# Altium schematic sheet Orion-Bridge-R4-Power.SchDoc
size A2
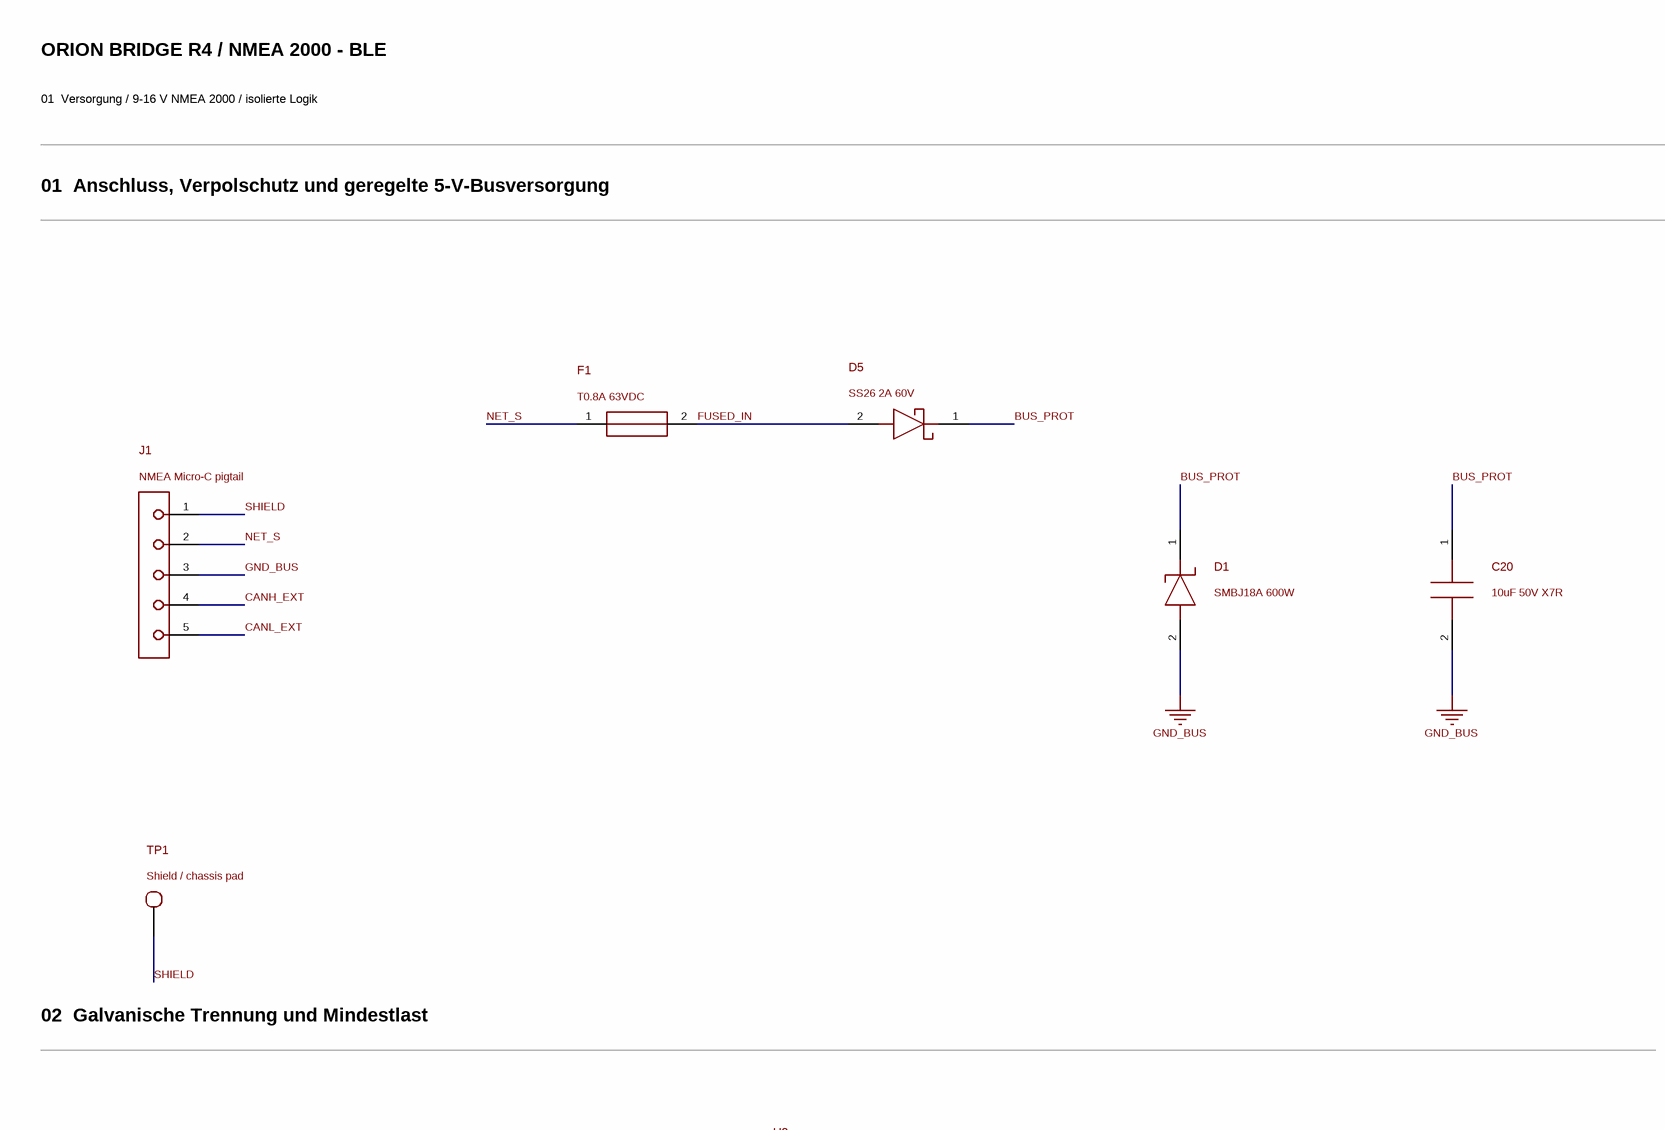
[diagram p0: Orion-Bridge-R4-Power.SchDoc, top left]
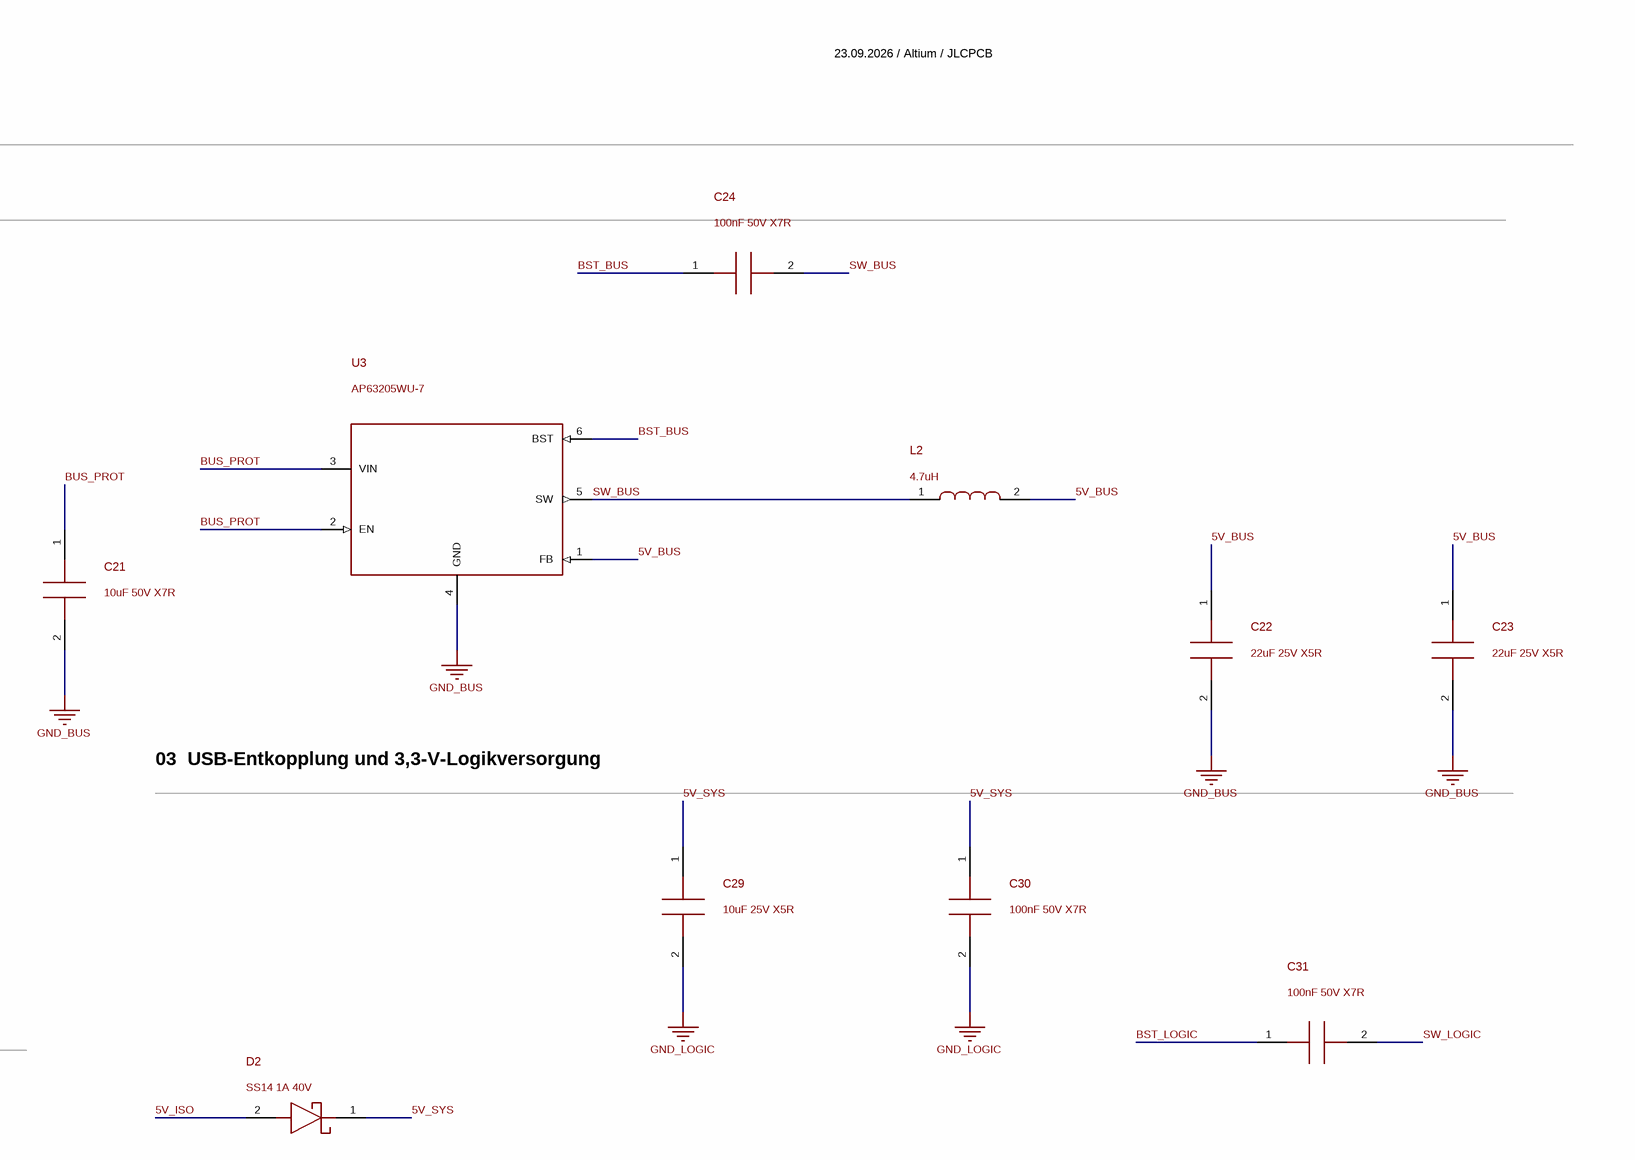
[diagram p1: Orion-Bridge-R4-Power.SchDoc, top right]
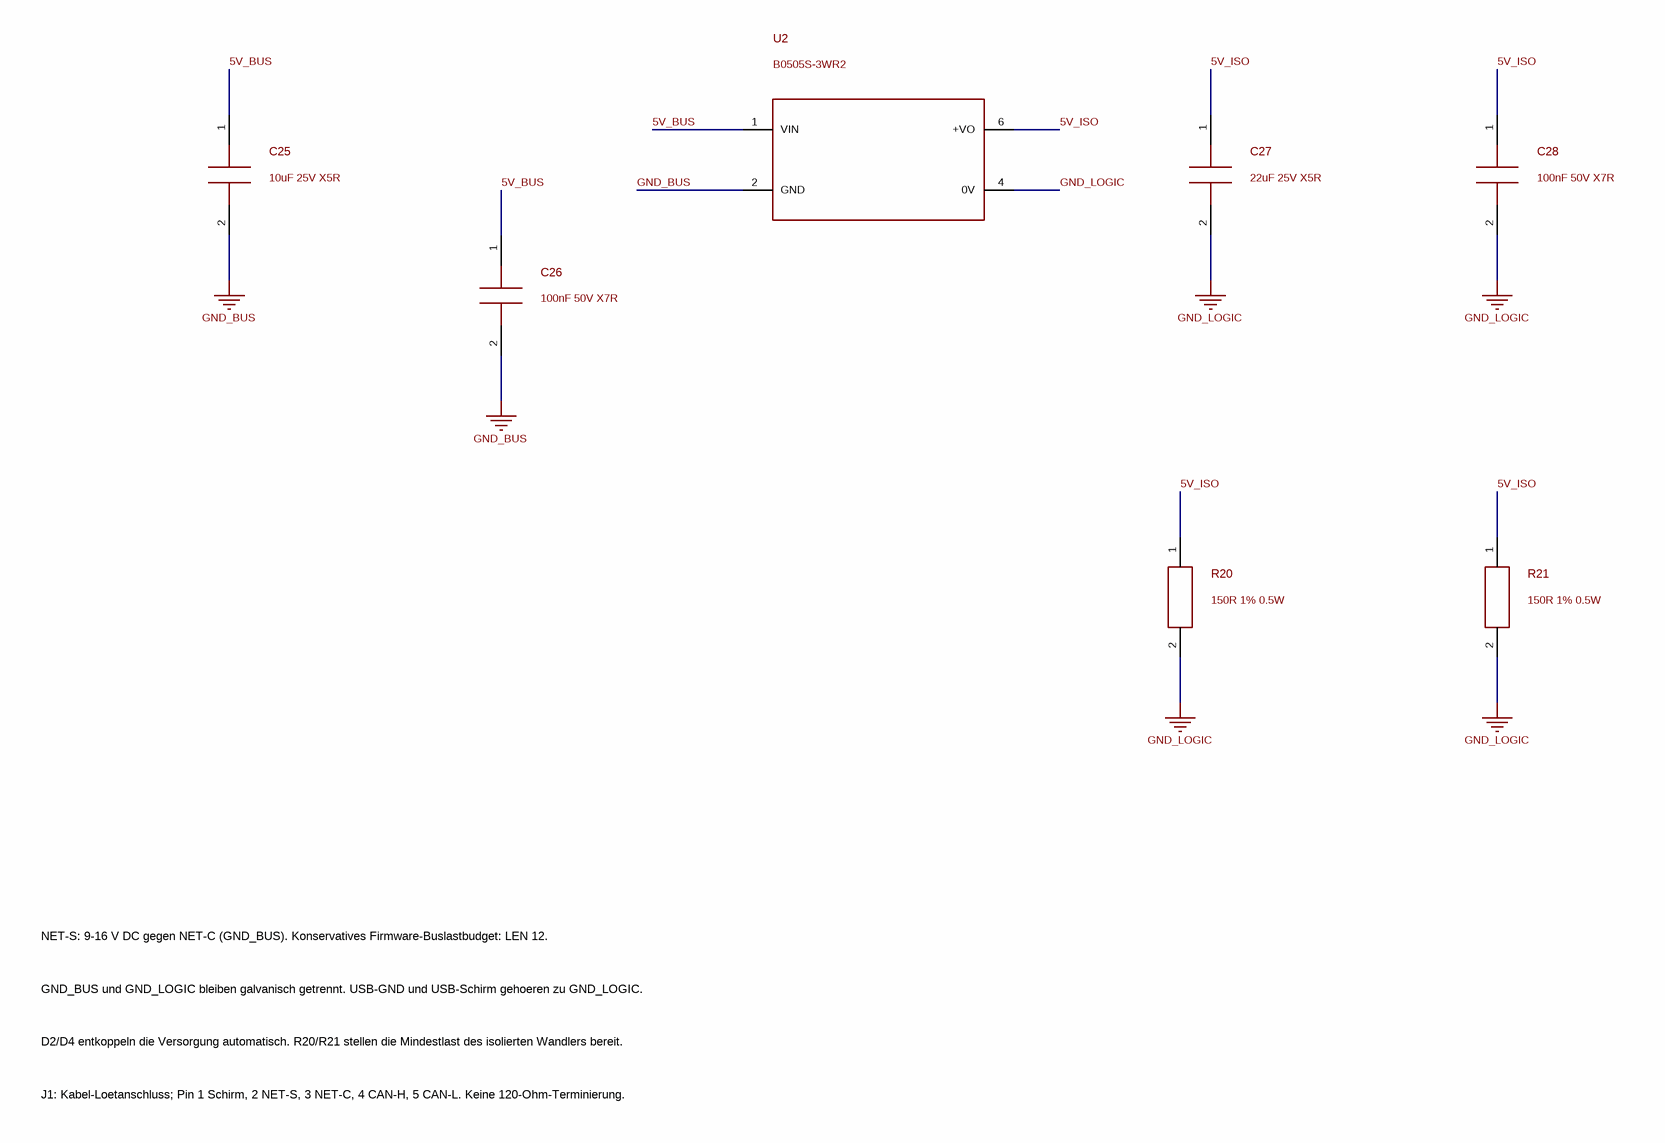
[diagram p2: Orion-Bridge-R4-Power.SchDoc, bottom left]
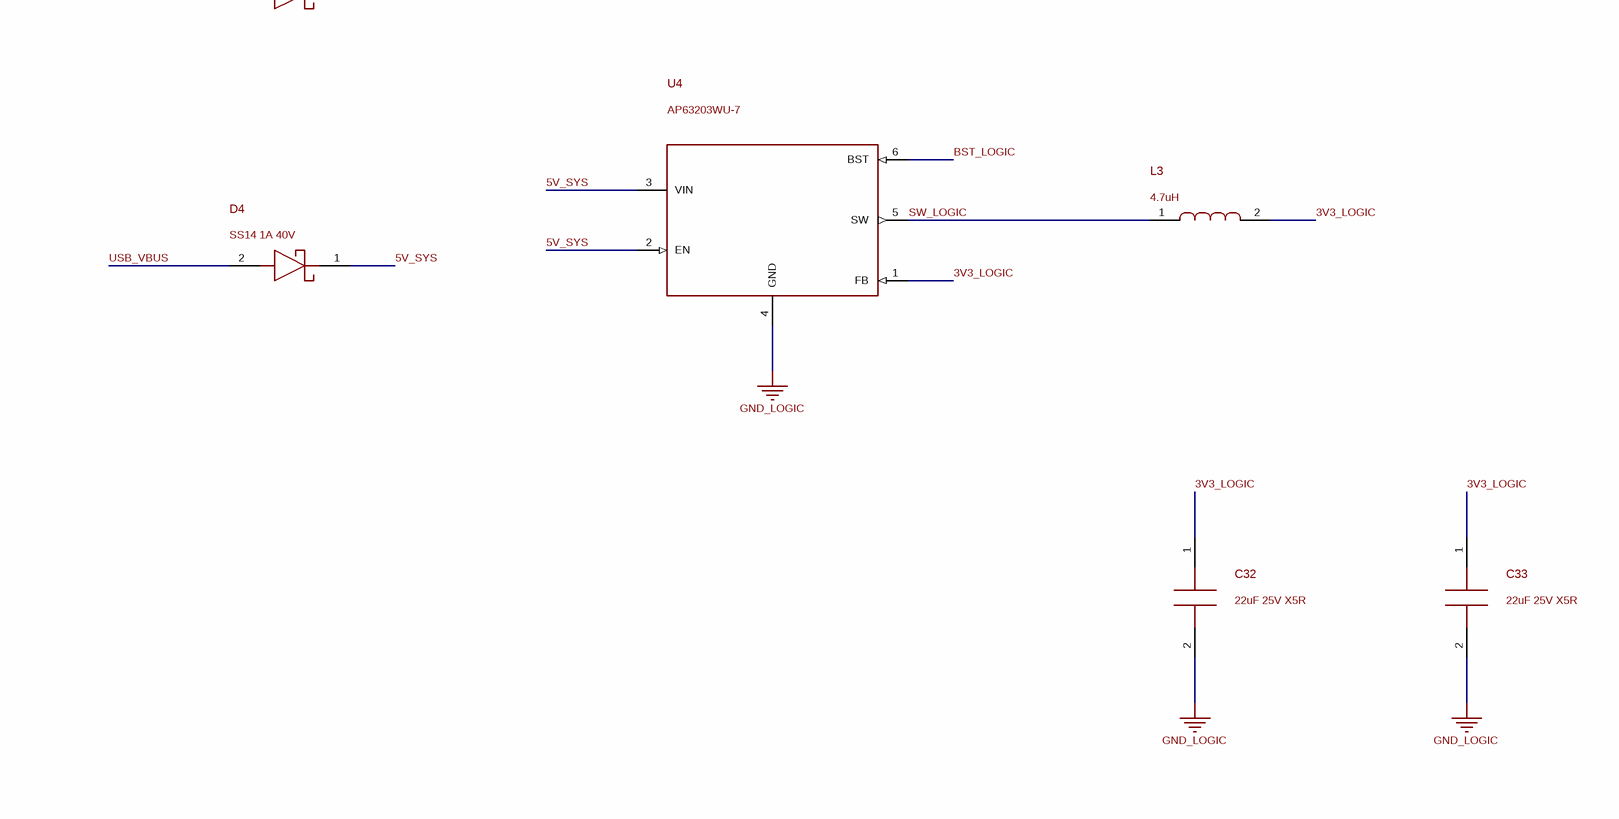
[diagram p3: Orion-Bridge-R4-Power.SchDoc, bottom right]

## Parts
C20  10uF 50V X7R  [C1210]
C21  10uF 50V X7R  [C1210]
C22  22uF 25V X5R  [C1206]
C23  22uF 25V X5R  [C1206]
C24  100nF 50V X7R  [C0603]
C25  10uF 25V X5R  [C0805]
C26  100nF 50V X7R  [C0603]
C27  22uF 25V X5R  [C1206]
C28  100nF 50V X7R  [C0603]
C29  10uF 25V X5R  [C0805]
C30  100nF 50V X7R  [C0603]
C31  100nF 50V X7R  [C0603]
C32  22uF 25V X5R  [C1206]
C33  22uF 25V X5R  [C1206]
D1  SMBJ18A 600W  [SMB]
D2  SS14 1A 40V  [SMA]
D4  SS14 1A 40V  [SMA]
D5  SS26 2A 60V  [SMA]
F1  T0.8A 63VDC  [BOURNS_SF1206S]
J1  NMEA Micro-C pigtail  [PIGTAIL_5_P3_D1P3]
L2  4.7uH  [SUNLORD_SWPA4030]
L3  4.7uH  [SUNLORD_SWPA4030]
R20  150R 1% 0.5W  [R1206]
R21  150R 1% 0.5W  [R1206]
TP1  Shield / chassis pad  [TESTPOINT_2MM]
U2  B0505S-3WR2  [EVISUN_B0505S_3WR2]
U3  AP63205WU-7  [TSOT26_DIODES]
U4  AP63203WU-7  [TSOT26_DIODES]

## Nets
GND_BUS: C20.2 C21.2 C22.2 C23.2 C25.2 C26.2 D1.2(A) J1.3(NET-C) U2.2(GND) U3.4(GND)
GND_LOGIC: C27.2 C28.2 C29.2 C30.2 C32.2 C33.2 R20.2 R21.2 U2.4(0V) U4.4(GND)
3V3_LOGIC: C32.1 C33.1 L3.2 U4.1(FB)
5V_BUS: C22.1 C23.1 C25.1 C26.1 L2.2 U2.1(VIN) U3.1(FB)
5V_ISO: C27.1 C28.1 D2.2(A) R20.1 R21.1 U2.6(+VO)
5V_SYS: C29.1 C30.1 D2.1(K) D4.1(K) U4.2(EN) U4.3(VIN)
BST_BUS: C24.1 U3.6(BST)
BST_LOGIC: C31.1 U4.6(BST)
BUS_PROT: C20.1 C21.1 D1.1(K) D5.1(K) U3.2(EN) U3.3(VIN)
CANH_EXT: J1.4(CAN-H)
CANL_EXT: J1.5(CAN-L)
FUSED_IN: D5.2(A) F1.2
NET_S: F1.1 J1.2(NET-S)
SHIELD: J1.1(SHIELD) TP1.1(SHIELD)
SW_BUS: C24.2 L2.1 U3.5(SW)
SW_LOGIC: C31.2 L3.1 U4.5(SW)
USB_VBUS: D4.2(A)

## Notes on the sheet
- ORION BRIDGE R4 / NMEA 2000 - BLE
- 23.09.2026 / Altium / JLCPCB
- 01  Versorgung / 9-16 V NMEA 2000 / isolierte Logik
- 01  Anschluss, Verpolschutz und geregelte 5-V-Busversorgung
- 03  USB-Entkopplung und 3,3-V-Logikversorgung
- 02  Galvanische Trennung und Mindestlast
- NET-S: 9-16 V DC gegen NET-C (GND_BUS). Konservatives Firmware-Buslastbudget: LEN 12.
- GND_BUS und GND_LOGIC bleiben galvanisch getrennt. USB-GND und USB-Schirm gehoeren zu GND_LOGIC.
- D2/D4 entkoppeln die Versorgung automatisch. R20/R21 stellen die Mindestlast des isolierten Wandlers bereit.
- J1: Kabel-Loetanschluss; Pin 1 Schirm, 2 NET-S, 3 NET-C, 4 CAN-H, 5 CAN-L. Keine 120-Ohm-Terminierung.

## Library data of the parts
C20 = R4_C20_10uF: Manufacturer: Samsung Electro-Mechanics; MPN: CL32B106KBJNNNE; ReviewStatus: R4 reviewed package; see source and assembly audit; Manufacturer Part Number: CL32B106KBJNNNE; Description: 10uF 50V X7R; Datasheet: https://datasheet.lcsc.com/lcsc/1912112237_Samsung-Electro-Mechanics-CL32B106KBJNNNE_C138687.pdf; Supplier 1: LCSC; Supplier Part Number 1: C138687; Footprint Status: R4 reviewed package; see source and assembly audit
C21 = R4_C21_10uF: Manufacturer: Samsung Electro-Mechanics; MPN: CL32B106KBJNNNE; ReviewStatus: R4 reviewed package; see source and assembly audit; Manufacturer Part Number: CL32B106KBJNNNE; Description: 10uF 50V X7R; Datasheet: https://datasheet.lcsc.com/lcsc/1912112237_Samsung-Electro-Mechanics-CL32B106KBJNNNE_C138687.pdf; Supplier 1: LCSC; Supplier Part Number 1: C138687; Footprint Status: R4 reviewed package; see source and assembly audit
C22 = R4_C22_22uF: Manufacturer: Samsung Electro-Mechanics; MPN: CL31A226KAHNNNE; ReviewStatus: R4 reviewed package; see source and assembly audit; Manufacturer Part Number: CL31A226KAHNNNE; Description: 22uF 25V X5R; Datasheet: https://www.lcsc.com/datasheet/lcsc_datasheet_2304140030_Samsung-Electro-Mechanics-CL31A226KAHNNNE_C12891.pdf; Supplier 1: LCSC; Supplier Part Number 1: C12891; Footprint Status: R4 reviewed package; see source and assembly audit
C23 = R4_C23_22uF: Manufacturer: Samsung Electro-Mechanics; MPN: CL31A226KAHNNNE; ReviewStatus: R4 reviewed package; see source and assembly audit; Manufacturer Part Number: CL31A226KAHNNNE; Description: 22uF 25V X5R; Datasheet: https://www.lcsc.com/datasheet/lcsc_datasheet_2304140030_Samsung-Electro-Mechanics-CL31A226KAHNNNE_C12891.pdf; Supplier 1: LCSC; Supplier Part Number 1: C12891; Footprint Status: R4 reviewed package; see source and assembly audit
C24 = R4_C24_100nF: Manufacturer: YAGEO; MPN: CC0603KRX7R9BB104; ReviewStatus: R4 reviewed package; see source and assembly audit; Manufacturer Part Number: CC0603KRX7R9BB104; Description: 100nF 50V X7R; Datasheet: https://www.lcsc.com/datasheet/lcsc_datasheet_2211101700_YAGEO-CC0603KRX7R9BB104_C14663.pdf; Supplier 1: LCSC; Supplier Part Number 1: C14663; Footprint Status: R4 reviewed package; see source and assembly audit
C25 = R4_C25_10uF: Manufacturer: Samsung Electro-Mechanics; MPN: CL21A106KAYNNNE; ReviewStatus: R4 reviewed package; see source and assembly audit; Manufacturer Part Number: CL21A106KAYNNNE; Description: 10uF 25V X5R; Datasheet: https://www.lcsc.com/datasheet/lcsc_datasheet_2304140030_Samsung-Electro-Mechanics-CL21A106KAYNNNE_C15850.pdf; Supplier 1: LCSC; Supplier Part Number 1: C15850; Footprint Status: R4 reviewed package; see source and assembly audit
C26 = R4_C26_100nF: Manufacturer: YAGEO; MPN: CC0603KRX7R9BB104; ReviewStatus: R4 reviewed package; see source and assembly audit; Manufacturer Part Number: CC0603KRX7R9BB104; Description: 100nF 50V X7R; Datasheet: https://www.lcsc.com/datasheet/lcsc_datasheet_2211101700_YAGEO-CC0603KRX7R9BB104_C14663.pdf; Supplier 1: LCSC; Supplier Part Number 1: C14663; Footprint Status: R4 reviewed package; see source and assembly audit
C27 = R4_C27_22uF: Manufacturer: Samsung Electro-Mechanics; MPN: CL31A226KAHNNNE; ReviewStatus: R4 reviewed package; see source and assembly audit; Manufacturer Part Number: CL31A226KAHNNNE; Description: 22uF 25V X5R; Datasheet: https://www.lcsc.com/datasheet/lcsc_datasheet_2304140030_Samsung-Electro-Mechanics-CL31A226KAHNNNE_C12891.pdf; Supplier 1: LCSC; Supplier Part Number 1: C12891; Footprint Status: R4 reviewed package; see source and assembly audit
C28 = R4_C28_100nF: Manufacturer: YAGEO; MPN: CC0603KRX7R9BB104; ReviewStatus: R4 reviewed package; see source and assembly audit; Manufacturer Part Number: CC0603KRX7R9BB104; Description: 100nF 50V X7R; Datasheet: https://www.lcsc.com/datasheet/lcsc_datasheet_2211101700_YAGEO-CC0603KRX7R9BB104_C14663.pdf; Supplier 1: LCSC; Supplier Part Number 1: C14663; Footprint Status: R4 reviewed package; see source and assembly audit
C29 = R4_C29_10uF: Manufacturer: Samsung Electro-Mechanics; MPN: CL21A106KAYNNNE; ReviewStatus: R4 reviewed package; see source and assembly audit; Manufacturer Part Number: CL21A106KAYNNNE; Description: 10uF 25V X5R; Datasheet: https://www.lcsc.com/datasheet/lcsc_datasheet_2304140030_Samsung-Electro-Mechanics-CL21A106KAYNNNE_C15850.pdf; Supplier 1: LCSC; Supplier Part Number 1: C15850; Footprint Status: R4 reviewed package; see source and assembly audit
C30 = R4_C30_100nF: Manufacturer: YAGEO; MPN: CC0603KRX7R9BB104; ReviewStatus: R4 reviewed package; see source and assembly audit; Manufacturer Part Number: CC0603KRX7R9BB104; Description: 100nF 50V X7R; Datasheet: https://www.lcsc.com/datasheet/lcsc_datasheet_2211101700_YAGEO-CC0603KRX7R9BB104_C14663.pdf; Supplier 1: LCSC; Supplier Part Number 1: C14663; Footprint Status: R4 reviewed package; see source and assembly audit
C31 = R4_C31_100nF: Manufacturer: YAGEO; MPN: CC0603KRX7R9BB104; ReviewStatus: R4 reviewed package; see source and assembly audit; Manufacturer Part Number: CC0603KRX7R9BB104; Description: 100nF 50V X7R; Datasheet: https://www.lcsc.com/datasheet/lcsc_datasheet_2211101700_YAGEO-CC0603KRX7R9BB104_C14663.pdf; Supplier 1: LCSC; Supplier Part Number 1: C14663; Footprint Status: R4 reviewed package; see source and assembly audit
C32 = R4_C32_22uF: Manufacturer: Samsung Electro-Mechanics; MPN: CL31A226KAHNNNE; ReviewStatus: R4 reviewed package; see source and assembly audit; Manufacturer Part Number: CL31A226KAHNNNE; Description: 22uF 25V X5R; Datasheet: https://www.lcsc.com/datasheet/lcsc_datasheet_2304140030_Samsung-Electro-Mechanics-CL31A226KAHNNNE_C12891.pdf; Supplier 1: LCSC; Supplier Part Number 1: C12891; Footprint Status: R4 reviewed package; see source and assembly audit
C33 = R4_C33_22uF: Manufacturer: Samsung Electro-Mechanics; MPN: CL31A226KAHNNNE; ReviewStatus: R4 reviewed package; see source and assembly audit; Manufacturer Part Number: CL31A226KAHNNNE; Description: 22uF 25V X5R; Datasheet: https://www.lcsc.com/datasheet/lcsc_datasheet_2304140030_Samsung-Electro-Mechanics-CL31A226KAHNNNE_C12891.pdf; Supplier 1: LCSC; Supplier Part Number 1: C12891; Footprint Status: R4 reviewed package; see source and assembly audit
D1 = R4_D1_SMBJ18A: Manufacturer: BORN; ReviewStatus: R4 reviewed package; see source and assembly audit; MPN: SMBJ18A; Manufacturer Part Number: SMBJ18A; Description: SMBJ18A 600W; Datasheet: https://www.lcsc.com/datasheet/lcsc_datasheet_2304140030_BORN-SMBJ18A_C152104.pdf; Supplier 1: LCSC; Supplier Part Number 1: C152104; Footprint Status: R4 reviewed package; see source and assembly audit
D2 = R4_D2_SS14: Manufacturer: MDD(Microdiode Semiconductor); ReviewStatus: R4 reviewed package; see source and assembly audit; MPN: SS14; Manufacturer Part Number: SS14; Description: SS14 1A 40V; Datasheet: https://www.lcsc.com/datasheet/lcsc_datasheet_2407101109_MDD-Microdiode-Semiconductor-SS14_C2480.pdf; Supplier 1: LCSC; Supplier Part Number 1: C2480; Footprint Status: R4 reviewed package; see source and assembly audit
D4 = R4_D4_SS14: Manufacturer: MDD(Microdiode Semiconductor); ReviewStatus: R4 reviewed package; see source and assembly audit; MPN: SS14; Manufacturer Part Number: SS14; Description: SS14 1A 40V; Datasheet: https://www.lcsc.com/datasheet/lcsc_datasheet_2407101109_MDD-Microdiode-Semiconductor-SS14_C2480.pdf; Supplier 1: LCSC; Supplier Part Number 1: C2480; Footprint Status: R4 reviewed package; see source and assembly audit
D5 = R4_D5_SS26: Manufacturer: MDD(Microdiode Semiconductor); ReviewStatus: R4 reviewed package; see source and assembly audit; MPN: SS26; Manufacturer Part Number: SS26; Description: SS26 2A 60V; Datasheet: https://www.lcsc.com/datasheet/lcsc_datasheet_2407101107_MDD-Microdiode-Semiconductor-SS26_C14238.pdf; Supplier 1: LCSC; Supplier Part Number 1: C14238; Footprint Status: R4 reviewed package; see source and assembly audit
F1 = R4_F1_T0.8A: 0.8 A slow-blow SMD ceramic fuse, 63 VDC, 50 A interrupt rating; Manufacturer: BOURNS; MPN: SF-1206S080-2; ReviewStatus: R4 reviewed package; see source and assembly audit; Manufacturer Part Number: SF-1206S080-2; Datasheet: https://wmsc.lcsc.com/wmsc/upload/file/pdf/v2/lcsc/2304140030_BOURNS-SF-1206S080-2_C3032873.pdf; Supplier 1: LCSC; Supplier Part Number 1: C3032873; Footprint Status: R4 reviewed package; see source and assembly audit
J1 = R4_J1_NMEA: Five direct wire-solder pads for a separately selected Micro-C cable; this is a PCB interface, not an invented connector MPN or face view; ReviewStatus: R4 reviewed package; see source and assembly audit; Footprint Status: R4 reviewed package; see source and assembly audit
L2 = R4_L2_4.7uH: Manufacturer: Sunlord; MPN: SWPA4030S4R7MT; ReviewStatus: R4 reviewed package; see source and assembly audit; Manufacturer Part Number: SWPA4030S4R7MT; Description: 4.7uH; Datasheet: https://www.lcsc.com/datasheet/lcsc_datasheet_2310251551_Sunlord-SWPA4030S4R7MT_C57269.pdf; Supplier 1: LCSC; Supplier Part Number 1: C57269; Footprint Status: R4 reviewed package; see source and assembly audit
L3 = R4_L3_4.7uH: Manufacturer: Sunlord; MPN: SWPA4030S4R7MT; ReviewStatus: R4 reviewed package; see source and assembly audit; Manufacturer Part Number: SWPA4030S4R7MT; Description: 4.7uH; Datasheet: https://www.lcsc.com/datasheet/lcsc_datasheet_2310251551_Sunlord-SWPA4030S4R7MT_C57269.pdf; Supplier 1: LCSC; Supplier Part Number 1: C57269; Footprint Status: R4 reviewed package; see source and assembly audit
R20 = R4_R20_150R: Manufacturer: SEI(Stackpole Elec); MPN: RNCP1206FTD150R; ReviewStatus: R4 reviewed package; see source and assembly audit; Manufacturer Part Number: RNCP1206FTD150R; Description: 150R 1% 0.5W; Datasheet: https://wmsc.lcsc.com/wmsc/upload/file/pdf/v2/lcsc/2404111532_SEI-Stackpole-Elec-RNCP1206FTD150R_C4258541.pdf; Supplier 1: LCSC; Supplier Part Number 1: C4258541; Footprint Status: R4 reviewed package; see source and assembly audit
R21 = R4_R21_150R: Manufacturer: SEI(Stackpole Elec); MPN: RNCP1206FTD150R; ReviewStatus: R4 reviewed package; see source and assembly audit; Manufacturer Part Number: RNCP1206FTD150R; Description: 150R 1% 0.5W; Datasheet: https://wmsc.lcsc.com/wmsc/upload/file/pdf/v2/lcsc/2404111532_SEI-Stackpole-Elec-RNCP1206FTD150R_C4258541.pdf; Supplier 1: LCSC; Supplier Part Number 1: C4258541; Footprint Status: R4 reviewed package; see source and assembly audit
TP1 = R4_TP1_Shield: Shield / chassis pad - generic specification; manufacturer/MPN not selected; ReviewStatus: R4 reviewed package; see source and assembly audit; Footprint Status: R4 reviewed package; see source and assembly audit
U2 = R4_U2_B0505S_3WR2: Manufacturer: EVISUN; ReviewStatus: R4 reviewed package; see source and assembly audit; MPN: B0505S-3WR2; Manufacturer Part Number: B0505S-3WR2; Description: B0505S-3WR2; Datasheet: https://wmsc.lcsc.com/wmsc/upload/file/pdf/v2/lcsc/2308311627_EVISUN-B0505S-3WR2_C7500927.pdf; Supplier 1: LCSC; Supplier Part Number 1: C7500927; Footprint Status: R4 reviewed package; see source and assembly audit
U3 = R4_U3_AP63205WU_7: Manufacturer: Diodes Incorporated; ReviewStatus: R4 reviewed package; see source and assembly audit; MPN: AP63205WU-7; Manufacturer Part Number: AP63205WU-7; Description: AP63205WU-7; Datasheet: https://www.lcsc.com/datasheet/lcsc_datasheet_2210280930_Diodes-Incorporated-AP63205WU-7_C2071056.pdf; Supplier 1: LCSC; Supplier Part Number 1: C2071056; Footprint Status: R4 reviewed package; see source and assembly audit
U4 = R4_U4_AP63203WU_7: Manufacturer: Diodes Incorporated; ReviewStatus: R4 reviewed package; see source and assembly audit; MPN: AP63203WU-7; Manufacturer Part Number: AP63203WU-7; Description: AP63203WU-7; Datasheet: https://www.lcsc.com/datasheet/lcsc_datasheet_2201131130_Diodes-Incorporated-AP63203WU-7_C780769.pdf; Supplier 1: LCSC; Supplier Part Number 1: C780769; Footprint Status: R4 reviewed package; see source and assembly audit